# Altium project Main_Board.PrjPcb (part 38 of 44)

## Sheet uSD.SchDoc: uSD
size A4
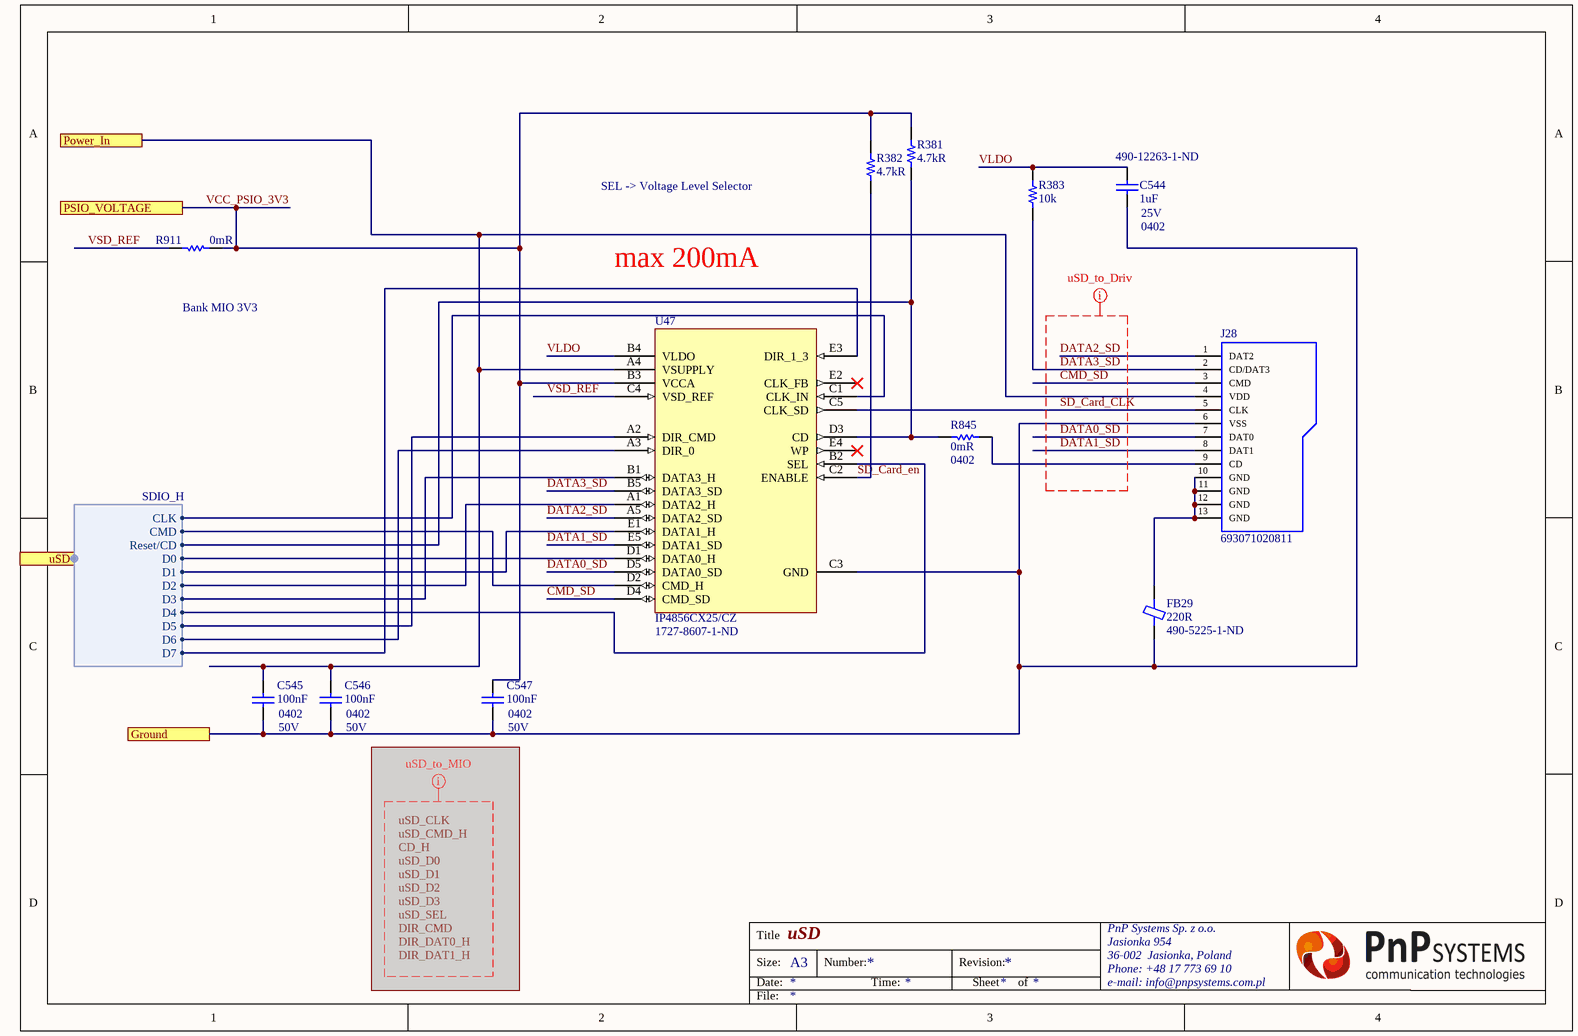
[diagram p62: uSD.SchDoc]

### Parts
(Parts that share a designator on the sheet are numbered #1, #2 ... from top to bottom, then left to right.)
C544  1uF  Supplier Part Number 1: 490-12263-1-ND  Case/Package: 0402  Voltage Rating: 25V  [CAP 0402/1005 KK]
C545  100nF  Case Code (Imperial): 0402  Voltage: 50V  [CAP 0402/1005 KK]
C546  100nF  Case Code (Imperial): 0402  Voltage: 50V  [CAP 0402/1005 KK]
C547  100nF  Case Code (Imperial): 0402  Voltage: 50V  [CAP 0402/1005 KK]
FB29  220R  Supplier Part Number 1: 490-5225-1-ND  [FER 0603/1608]
J28  693071020811  [693071020811]
R381  4.7kR  [RES 0402/1005 RF KK]
R382  4.7kR  [RES 0402/1005 RF KK]
R383  10k  [RES 0402/1005 RF KK]
R845#2  0mR  Case/Package: 0402  [RES 0402/1005 RF KK]
R911  0mR  [RES 0402/1005 RF KK]
U47  IP4856CX25/CZ  Supplier Part Number 1: 1727-8607-1-ND  [IP4856CX25/C]

### Ports
Ground, Power_In, PSIO_VOLTAGE, uSD (harness SDIO_H)

### Harnesses
SDIO_H: CLK, CMD, Reset/CD, D0, D1, D2, D3, D4, D5, D6, D7

### Nets
B503_Ground: C544.1 C545.1 C546.1 C547.1 FB29.2 J28.6(VSS) U47.C3(GND) ; port Ground
3V3_RAIL: C545.2 C546.2 J28.4(VDD) U47.A4(VSUPPLY) ; port Power_In
CMD_SD: J28.3(CMD) U47.D4(CMD_SD)
DATA0_SD: J28.7(DAT0) U47.D5(DATA0_SD)
DATA1_SD: J28.8(DAT1) U47.E5(DATA1_SD)
DATA2_SD: J28.1(DAT2) U47.A5(DATA2_SD)
DATA3_SD: J28.2(CD/DAT3) R383.2 U47.B5(DATA3_SD)
SD_Card_CLK: J28.5(CLK) U47.C5(CLK_SD)
SD_Card_en: R382.1 U47.C2(ENABLE)
uSD_CD: R381.1 R845#2.2 U47.D3(CD) ; port uSD.Reset/CD
uSD_CLK: U47.C1(CLK_IN) ; port uSD.CLK
uSD_CMD: U47.D2(CMD_H) ; port uSD.CMD
uSD_D0: U47.D1(DATA0_H) ; port uSD.D0
uSD_D1: U47.E1(DATA1_H) ; port uSD.D1
uSD_D2: U47.A1(DATA2_H) ; port uSD.D2
uSD_D3: U47.B1(DATA3_H) ; port uSD.D3
uSD_D4: U47.B2(SEL) ; port uSD.D4
uSD_D5: U47.A2(DIR_CMD) ; port uSD.D5
uSD_D6: U47.A3(DIR_0) ; port uSD.D6
uSD_D7: U47.E3(DIR_1_3) ; port uSD.D7
VCC_PSIO_3V3: C547.2 R381.2 R382.2 R911.1 U47.B3(VCCA) ; port PSIO_VOLTAGE  [project net ETH_VDDIO]
VLDO: C544.2 R383.1 U47.B4(VLDO)
VSD_REF: R911.2 U47.C4(VSD_REF)
NetFB29_1: FB29.1 J28.10(GND) J28.11(GND) J28.12(GND) J28.13(GND)
NetJ28_9: J28.9(CD) R845#2.1

Not connected (* = marked no-connect by the designer): U47 E2(CLK_FB)* E4(WP)*

### Layout directives
net class uSD_to_MIO: CD_H, DIR_CMD, DIR_DAT0_H, DIR_DAT1_H, uSD_CLK, uSD_CMD_H, uSD_D0, uSD_D1, uSD_D2, uSD_D3, uSD_SEL
net class uSD_to_Driv: CMD_SD, DATA0_SD, DATA1_SD, DATA2_SD, DATA3_SD, SD_Card_CLK

### Notes on the sheet
- SEL -> Voltage Level Selector
- Bank MIO 3V3
- max 200mA
- Title
- Size:
- Date:
- A3
- Number:
- Time:
- Revision:
- Sheet
- of
- File:

### Library data of the parts
C544 = Capacitor: as C485 on sheet RJ45; Supplier 1: Digi-Key; Manufacturer: Murata; Manufacturer Part Number: GRT155R61E105KE01D; RoHS: Yes; Category: Ceramic Capacitors; Stock 1: 415681; Pricing 1: 1=0,18000, 10=0,12300, 100=0,06210, 500=0,04248, 1000=0,03758, 2500=0,03594, 5000=0,03268 (USD); Mount: Surface Mount; Case Code (Metric): 1005; Case Code (Imperial): 0402; Min Operating Temperature: -55°C; Max Operating Temperature: 85°C; Packaging: Tape and Reel; Capacitance: 1uF; Tolerance: 10%; Dielectric: X5R; Voltage Rating (DC): 25V; Length: 0.039inch; Width: 0.02inch; Thickness: 0.022inch; Ratings: AEC-Q200; ComponentLink1URL: http://www.farnell.com/datasheets/2165918.pdf?src-supplier=Farnell; ComponentLink1Description: http://www.farnell.com/datasheets/2165918.pdf?src-supplier=Farnell; ComponentLink2URL: http://search.murata.co.jp/Ceramy/image/img/A01X/G101/ENG/GRT155R61E105KE01-01.pdf?src-supplier=Digi-Key; ComponentLink2Description: http://search.murata.co.jp/Ceramy/image/img/A01X/G101/ENG/GRT155R61E105KE01-01.pdf?src-supplier=Digi-Key; ComponentLink3URL: http://www.farnell.com/datasheets/2165918.pdf?src-supplier=Element14; ComponentLink3Description: http://www.farnell.com/datasheets/2165918.pdf?src-supplier=Element14
C545-C547 = Capacitor: as C471-C474 on sheet RJ45; Supplier 1: Digi-Key; Supplier Part Number 1: 490-10697-1-ND; RoHS: Yes; Category: Ceramic Capacitors; Stock 1: 435607; Pricing 1: 1=0,10000, 10=0,04600, 100=0,02050, 500=0,01464, 1000=0,01150, 2500=0,01045, 5000=0,00961 (USD); Mount: Surface Mount; Case/Package: 0402; Weight: 0.000212oz; Case Code (Metric): 1005; Min Operating Temperature: -55°C; Max Operating Temperature: 85°C; Capacitance: 100nF; Packaging: Tape and Reel; Voltage Rating: 50V; Dielectric: X5R; Termination: SMD/SMT; Composition: Ceramic; Voltage Rating (DC): 50V; Package Quantity: 10000; Length: 1mm; Height: 0.5mm; Width: 0.02inch; Thickness: 0.022inch; Depth: 0.5mm; REACH SVHC: No SVHC; Lead Free: Lead Free; ComponentLink1URL: http://www.farnell.com/datasheets/2079150.pdf?src-supplier=Farnell; ComponentLink1Description: http://www.farnell.com/datasheets/2079150.pdf?src-supplier=Farnell; ComponentLink2URL: http://www.mouser.com/ds/2/281/c02e-2905.pdf?src-supplier=Mouser; ComponentLink2Description: http://www.mouser.com/ds/2/281/c02e-2905.pdf?src-supplier=Mouser; ComponentLink3URL: http://www.farnell.com/datasheets/2079150.pdf?src-supplier=Element14; ComponentLink3Description: http://www.farnell.com/datasheets/2079150.pdf?src-supplier=Element14; ComponentLink4URL: http://search.murata.co.jp/Ceramy/image/img/A01X/G101/ENG/GRM155R61H104KE14-01.pdf?src-supplier=Digi-Key; ComponentLink4Description: http://search.murata.co.jp/Ceramy/image/img/A01X/G101/ENG/GRM155R61H104KE14-01.pdf?src-supplier=Digi-Key
FB29 = Ferrite: FERRITE BEAD 220 OHM 0603 1LN; Manufacturer: Murata; Manufacturer Part Number: BLM18SG221TN1D; Material: Ferrite,Steel; Tolerance: 25%; Max Current Rating: 2.5A; Number of Lines: 1; DC Resistance (DCR): 40mR; Test Frequency: 100MHz; Supplier 1: Digi-Key; RoHS: Yes; Category: Inductors; Stock 1: 123623; Pricing 1: 1=0,14000, 10=0,11600, 25=0,09040, 50=0,07500, 100=0,06460, 250=0,05172, 500=0,04654, 1000=0,03878, 5000=0,03619 (USD); Case/Package: 0603; Number of Pins: 2; Weight: 7.1E-05oz; Core Material: Ferrite; Case Code (Metric): 1608; Case Code (Imperial): 0603; Min Operating Temperature: -55°C; Max Operating Temperature: 125°C; Package Quantity: 1; Impedance: 220R; Packaging: Tape and Reel; Current Rating: 2.5A; Termination: SMD/SMT; Max DC Current: 2.5A; DC Current: 2.5A; Number of Circuits: 1; Length: 1.6mm; Height: 0.8mm; Width: 0.8mm; Depth: 0.95mm; Radiation Hardening: No; REACH SVHC: No SVHC; Lead Free: Lead Free; ComponentLink1URL: https://datasheet.ciiva.com/1561/c31e-1561456.pdf?src-supplier=Newark; ComponentLink1Description: https://datasheet.ciiva.com/1561/c31e-1561456.pdf?src-supplier=Newark; ComponentLink2URL: https://datasheet.ciiva.com/41449/001171724-da-01-en-chip-drossel0603-220r-2500ma-1-6x0-8mm-41449352.pdf?src-supplier=Conrad; ComponentLink2Description: https://datasheet.ciiva.com/41449/001171724-da-01-en-chip-drossel0603-220r-2500ma-1-6x0-8mm-41449352.pdf?src-supplier=Conrad; ComponentLink3URL: https://datasheet.ciiva.com/41449/001172313-da-01-en-drossel-0603-220r-21-6x0-8mm-10000st-41449677.pdf?src-supplier=Conrad; ComponentLink3Description: https://datasheet.ciiva.com/41449/001172313-da-01-en-drossel-0603-220r-21-6x0-8mm-10000st-41449677.pdf?src-supplier=Conrad; ComponentLink4URL: https://datasheet.ciiva.com/1012/l0110s0100blm18s-1012626.pdf?src-supplier=Digi-Key; ComponentLink4Description: https://datasheet.ciiva.com/1012/l0110s0100blm18s-1012626.pdf?src-supplier=Digi-Key; ComponentLink5URL: https://datasheet.ciiva.com/1012/l0110s0100blm18s-1012627.pdf?src-supplier=Digi-Key; ComponentLink5Description: https://datasheet.ciiva.com/1012/l0110s0100blm18s-1012627.pdf?src-supplier=Digi-Key; ComponentLink6URL: https://datasheet.ciiva.com/1012/l0110s0100blm18s-1012628.pdf?src-supplier=Digi-Key; ComponentLink6Description: https://datasheet.ciiva.com/1012/l0110s0100blm18s-1012628.pdf?src-supplier=Digi-Key; ComponentLink7URL: https://datasheet.ciiva.com/17279/l0110s0100blm18s-17279573.pdf?src-supplier=Avnet+Europe; ComponentLink7Description: https://datasheet.ciiva.com/17279/l0110s0100blm18s-17279573.pdf?src-supplier=Avnet+Europe; ComponentLink8URL: https://datasheet.ciiva.com/8508/l0110s0100blm18s-8508310.pdf?src-supplier=Avnet; ComponentLink8Description: https://datasheet.ciiva.com/8508/l0110s0100blm18s-8508310.pdf?src-supplier=Avnet; ComponentLink9URL: https://datasheet.ciiva.com/8021/5151-8021517.pdf?src-supplier=Element14; ComponentLink9Description: https://datasheet.ciiva.com/8021/5151-8021517.pdf?src-supplier=Element14; ComponentLink10URL: https://datasheet.ciiva.com/16204/l0110s0100blm18s-16204029.pdf?src-supplier=Future+Electronics; ComponentLink10Description: https://datasheet.ciiva.com/16204/l0110s0100blm18s-16204029.pdf?src-supplier=Future+Electronics; ComponentLink11URL: https://datasheet.ciiva.com/14122/blm-series-eng-tds-14122910.pdf?src-supplier=Distrelec; ComponentLink11Description: https://datasheet.ciiva.com/14122/blm-series-eng-tds-14122910.pdf?src-supplier=Distrelec; ComponentLink12URL: https://datasheet.ciiva.com/8021/5151-8021519.pdf?src-supplier=Element14; ComponentLink12Description: https://datasheet.ciiva.com/8021/5151-8021519.pdf?src-supplier=Element14
J28 = 693071020811: WR-CRD Micro SD Card Connector Push & Push; Contact Resistance: 100mOhm; Gender: Socket; Pin Number: 8; Working Voltage: 30VAC; Withstanding Voltage: 500VAC; Rated Current: 0.5A; ComponentLink1Description: Manufacturer; ComponentLink1URL: http://www.we-online.de; ComponentLink2Description: Datasheet; ComponentLink2URL: https://katalog.we-online.com/em/datasheet/693071020811.pdf; Packaging: Tape and Reel; Published Date: November 2019; Publisher: Wurth Elektronik; Mounting Technology: SMT; Operating Temperature: -40 to +85degC; Part Number: 693071020811; Type: Push & Push
R381 R382 = Resistor: Manufacturer: Panasonic; Manufacturer Part Number: ERJ-2RKF4701X; Tolerance: 1%; Temperature Coefficient: 100ppm/°C; Power Rating: 100mW; Voltage Rating: 50V; Supplier 1: Digi-Key; Supplier Part Number 1: P4.70KLCT-ND; Stock 1: 5361977; Pricing 1: 1 = 0,10000, 10 = 0,05500, 100 = 0,02250, 1000 = 0,01009, 2500 = 0,00876, 5000 = 0,00724 (USD); RoHS: Yes; Mount: Surface Mount; Case/Package: 0402; Number of Pins: 2; Case Code (Imperial): 0402; Case Code (Metric): 1005; Contact Plating: Tin; Min Operating Temperature: -55°C; Max Operating Temperature: 155°C; Resistance: 4.7kR; Packaging: Tape and Reel; Composition: Thick Film; Package Quantity: 1; Termination: SMD/SMT; Voltage Rating (DC): 50V; Number of Terminations: 2; Military Standard: Not; Max Power Dissipation: 100mW; Features: Automotive AEC-Q200; Length: 1mm; Height: 0.35mm; Width: 0.02inch; Depth: 0.5mm; Radiation Hardening: No; Lead Free: Lead Free; REACH SVHC: No SVHC; ComponentLink1URL: https://datasheet.ciiva.com/11821/0900766b80f80784-11821329.pdf?src-supplier=RSComponents; ComponentLink1Description: https://datasheet.ciiva.com/11821/0900766b80f80784-11821329.pdf?src-supplier=RSComponents; ComponentLink2URL: https://datasheet.ciiva.com/30053/aoa0000ce2-30053990.pdf?src-supplier=Onlinecomponents.com; ComponentLink2Description: https://datasheet.ciiva.com/30053/aoa0000ce2-30053990.pdf?src-supplier=Onlinecomponents.com; ComponentLink3URL: https://datasheet.ciiva.com/7830/aoa0000ce2-7830727.pdf?src-supplier=Element14; ComponentLink3Description: https://datasheet.ciiva.com/7830/aoa0000ce2-7830727.pdf?src-supplier=Element14; ComponentLink4URL: https://datasheet.ciiva.com/22781/1678782-22781576.pdf?src-supplier=Farnell; ComponentLink4Description: https://datasheet.ciiva.com/22781/1678782-22781576.pdf?src-supplier=Farnell; ComponentLink5URL: https://datasheet.ciiva.com/9195/aoa0000ce2-9195737.pdf?src-supplier=Avnet; ComponentLink5Description: https://datasheet.ciiva.com/9195/aoa0000ce2-9195737.pdf?src-supplier=Avnet; ComponentLink6URL: https://datasheet.ciiva.com/17213/aoa0000ce2-17213180.pdf?src-supplier=Avnet+Europe; ComponentLink6Description: https://datasheet.ciiva.com/17213/aoa0000ce2-17213180.pdf?src-supplier=Avnet+Europe; ComponentLink7URL: https://datasheet.ciiva.com/22667/1678782-22667886.pdf?src-supplier=Element14; ComponentLink7Description: https://datasheet.ciiva.com/22667/1678782-22667886.pdf?src-supplier=Element14; ComponentLink8URL: https://datasheet.ciiva.com/16763/70260748-16763151.pdf?src-supplier=Allied+Electronics; ComponentLink8Description: https://datasheet.ciiva.com/16763/70260748-16763151.pdf?src-supplier=Allied+Electronics; ComponentLink9URL: https://datasheet.ciiva.com/22723/1678782-22723903.pdf?src-supplier=Element14; ComponentLink9Description: https://datasheet.ciiva.com/22723/1678782-22723903.pdf?src-supplier=Element14; ComponentLink10URL: https://datasheet.ciiva.com/24025/aoa0000ce2-24025663.pdf?src-supplier=Mouser; ComponentLink10Description: https://datasheet.ciiva.com/24025/aoa0000ce2-24025663.pdf?src-supplier=Mouser
R383 = Resistor: SMT Resistor; Value: 10k; Part Number: *; Supplier 1: Digi-Key; Supplier Part Number 1: RR05P10.0KDCT-ND
R845#2 R911 = Resistor: as R711-R713 on sheet RJ45; Supplier 1: Digi-Key; Supplier Part Number 1: 311-0.0JRCT-ND; Stock 1: 69822252; Pricing 1: 1=0.10000, 10=0.01200, 25=0.00920, 50=0.00680, 100=0.00510, 250=0.00388, 500=0.00308, 1000=0.00227, 5000=0.00163 (USD); RoHS: Yes; Contact Plating: Tin,Matte; Case Code (Metric): 1005; Case Code (Imperial): 0402; Min Operating Temperature: -55°C; Max Operating Temperature: 155°C; Resistance: 0mR; Packaging: Tape and Reel; Composition: Thick Film; Package Quantity: 1; Number of Terminations: 2; Termination: SMD/SMT; Military Standard: Not; Features: Moisture Resistant; Length: 1mm; Height: 0.016inch; Width: 0.02inch; Depth: 0.5mm; Radiation Hardening: No; REACH SVHC: Unknown; Lead Free: Lead Free; ComponentLink1URL: https://datasheet.ciiva.com/2452/pyu-rc0402-51-rohs-l-6-2452608.pdf?src-supplier=Digi-Key; ComponentLink1Description: https://datasheet.ciiva.com/2452/pyu-rc0402-51-rohs-l-6-2452608.pdf?src-supplier=Digi-Key; ComponentLink2URL: https://datasheet.ciiva.com/11808/0900766b80c66297-11808195.pdf?src-supplier=RSComponents; ComponentLink2Description: https://datasheet.ciiva.com/11808/0900766b80c66297-11808195.pdf?src-supplier=RSComponents; ComponentLink3URL: https://datasheet.ciiva.com/2452/pyu-r-int-thick-7-2452609.pdf?src-supplier=Digi-Key; ComponentLink3Description: https://datasheet.ciiva.com/2452/pyu-r-int-thick-7-2452609.pdf?src-supplier=Digi-Key; ComponentLink4URL: https://datasheet.ciiva.com/22747/1018594-22747515.pdf?src-supplier=Element14; ComponentLink4Description: https://datasheet.ciiva.com/22747/1018594-22747515.pdf?src-supplier=Element14; ComponentLink5URL: https://datasheet.ciiva.com/7983/1018594-7983535.pdf?src-supplier=Element14; ComponentLink5Description: https://datasheet.ciiva.com/7983/1018594-7983535.pdf?src-supplier=Element14; ComponentLink6URL: https://datasheet.ciiva.com/2452/pyu-r-int-thick-7-2452610.pdf?src-supplier=Digi-Key; ComponentLink6Description: https://datasheet.ciiva.com/2452/pyu-r-int-thick-7-2452610.pdf?src-supplier=Digi-Key; ComponentLink7URL: https://datasheet.ciiva.com/8896/pyu-rc0402-51-rohs-l-6-8896201.pdf?src-supplier=Avnet; ComponentLink7Description: https://datasheet.ciiva.com/8896/pyu-rc0402-51-rohs-l-6-8896201.pdf?src-supplier=Avnet; ComponentLink8URL: https://datasheet.ciiva.com/28386/pyu-rc0402-51-rohs-l-6-28386633.pdf?src-supplier=Avnet+Europe; ComponentLink8Description: https://datasheet.ciiva.com/28386/pyu-rc0402-51-rohs-l-6-28386633.pdf?src-supplier=Avnet+Europe; ComponentLink9URL: https://datasheet.ciiva.com/15189/getdatasheetpartid-326379-15189533.pdf?src-supplier=Verical; ComponentLink9Description: https://datasheet.ciiva.com/15189/getdatasheetpartid-326379-15189533.pdf?src-supplier=Verical
  R911: Case/Package: 0402
U47 = IP4856CX25/CZ: Memory Card Interface 25-WLCSP (2.04x2.04); Manufacturer 1: Nexperia USA; Supplier 1: Digi-Key; Manufacturer Part Number 1: IP4856CX25/CZ; Stock 1: 3532; Pricing 1: 1=1,52000, 10=1,36500, 100=1,03000, 500=0,87550, 1000=0,69525 (USD); RoHS: No; ComponentLink1Description: Datasheet; ComponentLink1URL: https://assets.nexperia.com/documents/data-sheet/IP4856CX25_C.pdf

## Sheet FTDI.SchDoc
size A3; Organization: Altium Limited; Address1: L3, 12a Rodborough Rd; Address2: Frenchs Forest; Address3: NSW; Address4: Australia 2086
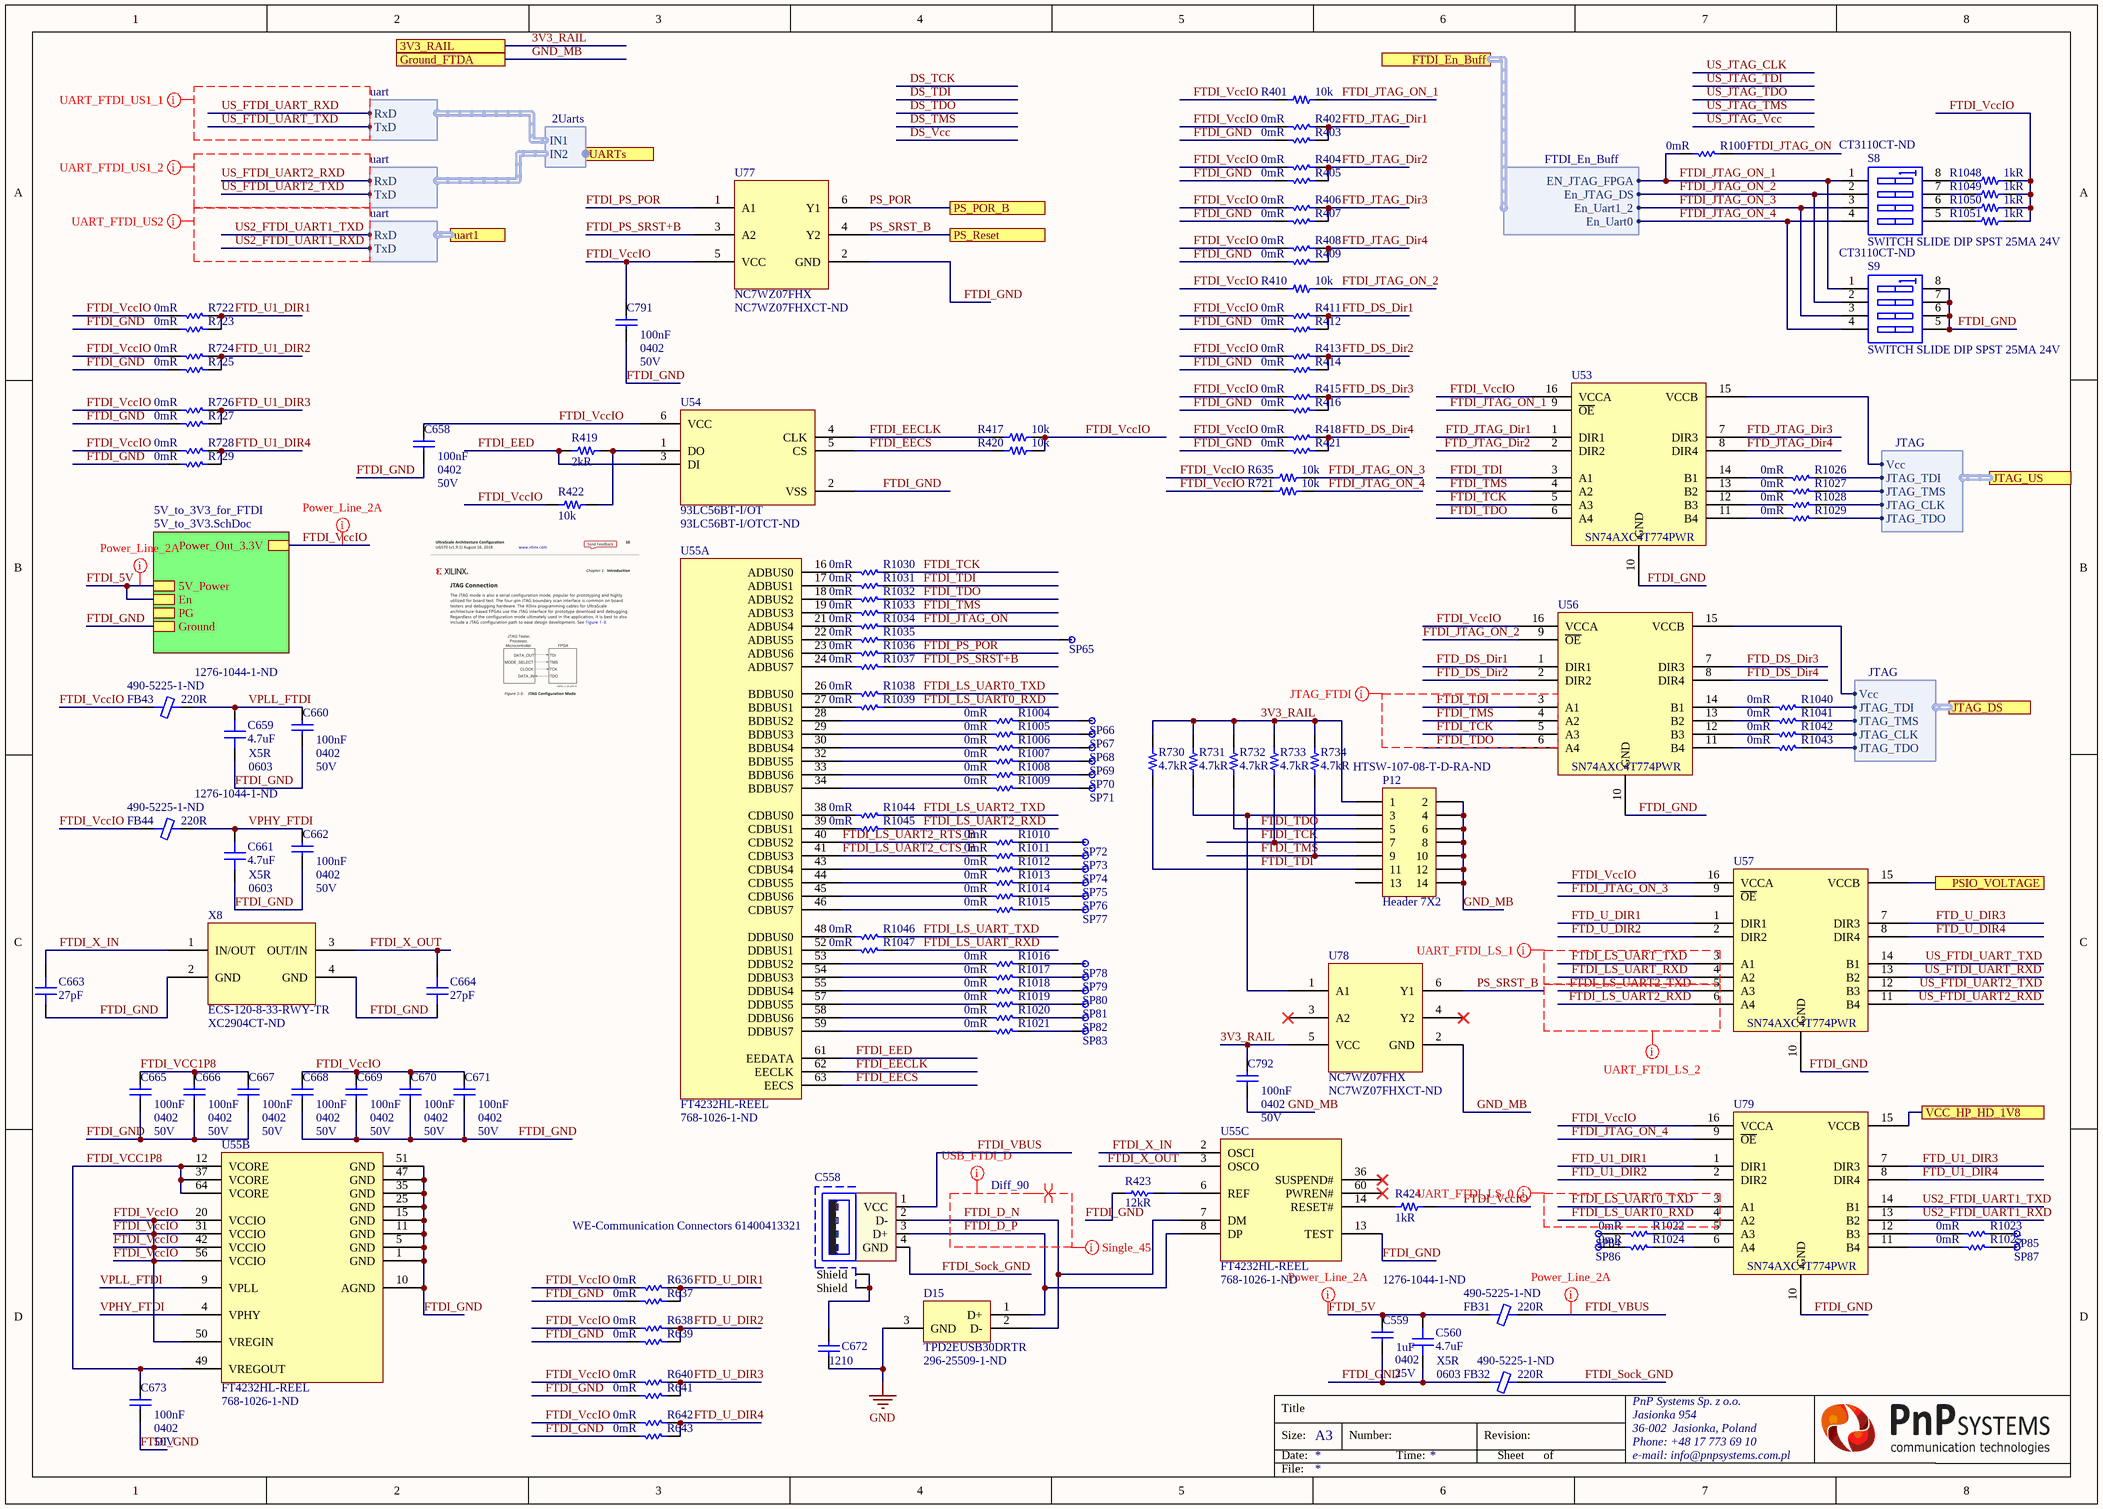
[diagram p63: FTDI.SchDoc]

### Parts
C558  WE-Communication Connectors 61400413321  [61400413321]
C559  1uF  Case/Package: 0402  Voltage Rating: 25V  [CAP 0402/1005 KK]
C560  4.7uF  Supplier Part Number 1: 1276-1044-1-ND  Case/Package: 0603  Dielectric: X5R  [CAP 0603/1608 RF]
C658  100nF  Case Code (Imperial): 0402  Voltage: 50V  [CAP 0402/1005 KK]
C659  4.7uF  Supplier Part Number 1: 1276-1044-1-ND  Case/Package: 0603  Dielectric: X5R  [CAP 0603/1608 RF]
C660  100nF  Case Code (Imperial): 0402  Voltage: 50V  [CAP 0402/1005 KK]
C661  4.7uF  Supplier Part Number 1: 1276-1044-1-ND  Case/Package: 0603  Dielectric: X5R  [CAP 0603/1608 RF]
C662  100nF  Case Code (Imperial): 0402  Voltage: 50V  [CAP 0402/1005 KK]
C663  27pF  [CAP 0402/1005 KK]
C664  27pF  [CAP 0402/1005 KK]
C665  100nF  Case Code (Imperial): 0402  Voltage: 50V  [CAP 0402/1005 KK]
C666  100nF  Case Code (Imperial): 0402  Voltage: 50V  [CAP 0402/1005 KK]
C667  100nF  Case Code (Imperial): 0402  Voltage: 50V  [CAP 0402/1005 KK]
C668  100nF  Case Code (Imperial): 0402  Voltage: 50V  [CAP 0402/1005 KK]
C669  100nF  Case Code (Imperial): 0402  Voltage: 50V  [CAP 0402/1005 KK]
C670  100nF  Case Code (Imperial): 0402  Voltage: 50V  [CAP 0402/1005 KK]
C671  100nF  Case Code (Imperial): 0402  Voltage: 50V  [CAP 0402/1005 KK]
C672  Case/Package: 1210  [CAPC3326X17L]  (hidden comment: Capacitor_1210)
C673  100nF  Case Code (Imperial): 0402  Voltage: 50V  [CAP 0402/1005 KK]
C791  100nF  Case Code (Imperial): 0402  Voltage: 50V  [CAP 0402/1005 KK]
C792  100nF  Case Code (Imperial): 0402  Voltage: 50V  [CAP 0402/1005 KK]
D15  TPD2EUSB30DRTR  Supplier Part Number 1: 296-25509-1-ND  [TPD2EUSB30]
FB31  220R  Supplier Part Number 1: 490-5225-1-ND  [FER 0603/1608]
FB32  220R  Supplier Part Number 1: 490-5225-1-ND  [FER 0603/1608]
FB43  220R  Supplier Part Number 1: 490-5225-1-ND  [FER 0603/1608]
FB44  220R  Supplier Part Number 1: 490-5225-1-ND  [FER 0603/1608]
P12  Header 7X2  Supplier Part Number 1: HTSW-107-08-T-D-RA-ND  [HDR2X7]
R401  10k  [RES 0402/1005 RF KK]
R402  0mR  [RES 0402/1005 RF KK]
R403  0mR  [RES 0402/1005 RF KK]
R404  0mR  [RES 0402/1005 RF KK]
R405  0mR  [RES 0402/1005 RF KK]
R406  0mR  [RES 0402/1005 RF KK]
R407  0mR  [RES 0402/1005 RF KK]
R408  0mR  [RES 0402/1005 RF KK]
R409  0mR  [RES 0402/1005 RF KK]
R410  10k  [RES 0402/1005 RF KK]
R411  0mR  [RES 0402/1005 RF KK]
R412  0mR  [RES 0402/1005 RF KK]
R413  0mR  [RES 0402/1005 RF KK]
R414  0mR  [RES 0402/1005 RF KK]
R415  0mR  [RES 0402/1005 RF KK]
R416  0mR  [RES 0402/1005 RF KK]
R417  10k  [RES 0402/1005 RF KK]
R418  0mR  [RES 0402/1005 RF KK]
R419  2kR  [RES 0402/1005 RF KK]
R420  10k  [RES 0402/1005 RF KK]
R421  0mR  [RES 0402/1005 RF KK]
R422  10k  [RES 0402/1005 RF KK]
R423  12kR  [RES 0402/1005 RF KK]
R424  1kR  [RES 0402/1005 RF KK]
R635  10k  [RES 0402/1005 RF KK]
R636  0mR  [RES 0402/1005 RF KK]
R637  0mR  [RES 0402/1005 RF KK]
R638  0mR  [RES 0402/1005 RF KK]
R639  0mR  [RES 0402/1005 RF KK]
R640  0mR  [RES 0402/1005 RF KK]
R641  0mR  [RES 0402/1005 RF KK]
R642  0mR  [RES 0402/1005 RF KK]
R643  0mR  [RES 0402/1005 RF KK]
R721  10k  [RES 0402/1005 RF KK]
R722  0mR  [RES 0402/1005 RF KK]
R723  0mR  [RES 0402/1005 RF KK]
R724  0mR  [RES 0402/1005 RF KK]
R725  0mR  [RES 0402/1005 RF KK]
R726  0mR  [RES 0402/1005 RF KK]
R727  0mR  [RES 0402/1005 RF KK]
R728  0mR  [RES 0402/1005 RF KK]
R729  0mR  [RES 0402/1005 RF KK]
R730  4.7kR  [RES 0402/1005 RF KK]
R731  4.7kR  [RES 0402/1005 RF KK]
R732  4.7kR  [RES 0402/1005 RF KK]
R733  4.7kR  [RES 0402/1005 RF KK]
R734  4.7kR  [RES 0402/1005 RF KK]
R1001  0mR  [RES 0402/1005 RF KK]
R1004  0mR  [RES 0402/1005 RF KK]
R1005  0mR  [RES 0402/1005 RF KK]
R1006  0mR  [RES 0402/1005 RF KK]
R1007  0mR  [RES 0402/1005 RF KK]
R1008  0mR  [RES 0402/1005 RF KK]
R1009  0mR  [RES 0402/1005 RF KK]
R1010  0mR  [RES 0402/1005 RF KK]
R1011  0mR  [RES 0402/1005 RF KK]
R1012  0mR  [RES 0402/1005 RF KK]
R1013  0mR  [RES 0402/1005 RF KK]
R1014  0mR  [RES 0402/1005 RF KK]
R1015  0mR  [RES 0402/1005 RF KK]
R1016  0mR  [RES 0402/1005 RF KK]
R1017  0mR  [RES 0402/1005 RF KK]
R1018  0mR  [RES 0402/1005 RF KK]
R1019  0mR  [RES 0402/1005 RF KK]
R1020  0mR  [RES 0402/1005 RF KK]
R1021  0mR  [RES 0402/1005 RF KK]
R1022  0mR  [RES 0402/1005 RF KK]
R1023  0mR  [RES 0402/1005 RF KK]
R1024  0mR  [RES 0402/1005 RF KK]
R1025  0mR  [RES 0402/1005 RF KK]
R1026  0mR  [RES 0402/1005 RF KK]
R1027  0mR  [RES 0402/1005 RF KK]
R1028  0mR  [RES 0402/1005 RF KK]
R1029  0mR  [RES 0402/1005 RF KK]
R1030  0mR  [RES 0402/1005 RF KK]
R1031  0mR  [RES 0402/1005 RF KK]
R1032  0mR  [RES 0402/1005 RF KK]
R1033  0mR  [RES 0402/1005 RF KK]
R1034  0mR  [RES 0402/1005 RF KK]
R1035  0mR  [RES 0402/1005 RF KK]
R1036  0mR  [RES 0402/1005 RF KK]
R1037  0mR  [RES 0402/1005 RF KK]
R1038  0mR  [RES 0402/1005 RF KK]
R1039  0mR  [RES 0402/1005 RF KK]
R1040  0mR  [RES 0402/1005 RF KK]
R1041  0mR  [RES 0402/1005 RF KK]
R1042  0mR  [RES 0402/1005 RF KK]
R1043  0mR  [RES 0402/1005 RF KK]
R1044  0mR  [RES 0402/1005 RF KK]
R1045  0mR  [RES 0402/1005 RF KK]
R1046  0mR  [RES 0402/1005 RF KK]
R1047  0mR  [RES 0402/1005 RF KK]
R1048  1kR  [RES 0402/1005 RF KK]
R1049  1kR  [RES 0402/1005 RF KK]
R1050  1kR  [RES 0402/1005 RF KK]
R1051  1kR  [RES 0402/1005 RF KK]
S8  SWITCH SLIDE DIP SPST 25MA 24V  Supplier Part Number 1: CT3110CT-ND  [SO8_N]
S9  SWITCH SLIDE DIP SPST 25MA 24V  Supplier Part Number 1: CT3110CT-ND  [SO8_N]
SP65  SP  [MeasureTP]  (value not drawn)
SP66  SP  [MeasureTP]  (value not drawn)
SP67  SP  [MeasureTP]  (value not drawn)
SP68  SP  [MeasureTP]  (value not drawn)
SP69  SP  [MeasureTP]  (value not drawn)
SP70  SP  [MeasureTP]  (value not drawn)
SP71  SP  [MeasureTP]  (value not drawn)
SP72  SP  [MeasureTP]  (value not drawn)
SP73  SP  [MeasureTP]  (value not drawn)
SP74  SP  [MeasureTP]  (value not drawn)
SP75  SP  [MeasureTP]  (value not drawn)
SP76  SP  [MeasureTP]  (value not drawn)
SP77  SP  [MeasureTP]  (value not drawn)
SP78  SP  [MeasureTP]  (value not drawn)
SP79  SP  [MeasureTP]  (value not drawn)
SP80  SP  [MeasureTP]  (value not drawn)
SP81  SP  [MeasureTP]  (value not drawn)
SP82  SP  [MeasureTP]  (value not drawn)
SP83  SP  [MeasureTP]  (value not drawn)
SP84  SP  [MeasureTP]  (value not drawn)
SP85  SP  [MeasureTP]  (value not drawn)
SP86  SP  [MeasureTP]  (value not drawn)
SP87  SP  [MeasureTP]  (value not drawn)
U53  SN74AXC4T774PWR  [SN74AXC4T774PWR]
U54  93LC56BT-I/OT  Supplier Part Number 1: 93LC56BT-I/OTCT-ND  [93LC56BT]
U55  FT4232HL-REEL  Supplier Part Number 1: 768-1026-1-ND  [FT4232HL]  (parts A,B,C of 3)
U56  SN74AXC4T774PWR  [SN74AXC4T774PWR]
U57  SN74AXC4T774PWR  [SN74AXC4T774PWR]
U77  NC7WZ07FHX  Supplier Part Number 1: NC7WZ07FHXCT-ND  [NC7WZ07FHX]
U78  NC7WZ07FHX  Supplier Part Number 1: NC7WZ07FHXCT-ND  [NC7WZ07FHX]
U79  SN74AXC4T774PWR  [SN74AXC4T774PWR]
X8  ECS-120-8-33-RWY-TR  Supplier Part Number 1: XC2904CT-ND  [ECS-120-8-33-RWY-TR]

### Sub-sheets
5V_to_3V3_for_FTDI = 5V_to_3V3.SchDoc: En, 5V_Power, PG, Ground, Power_Out_3.3V

### Ports
3V3_RAIL, FTDI_En_Buff (harness FTDI_En_Buff), Ground_FTDA, JTAG_DS (harness JTAG), JTAG_US (harness JTAG), PS_POR_B, PS_Reset, PSIO_VOLTAGE, uart1 (harness uart), UARTs (harness 2Uarts), VCC_HP_HD_1V8

### Harnesses
uart: RxD, TxD
JTAG: JTAG_CLK, JTAG_TDI, JTAG_TDO, JTAG_TMS, Vcc
FTDI_En_Buff: EN_JTAG_FPGA, En_JTAG_DS, En_Uart1_2, En_Uart0
2Uarts: IN1, IN2

### Nets
GND: C672.1 C792.1 D15.3(GND) P12.2 P12.4 P12.6 P12.8 P12.10 P12.12 P12.14 U78.2(GND) ; port Ground_FTDA  [also labelled GND_MB]  [project net B503_Ground]
3V3_RAIL: C792.2 P12.1 R730.2 R731.2 R732.2 R733.2 R734.2 U78.5(VCC) ; port 3V3_RAIL
ETH_VDDIO: U53.15(VCCB) U56.15(VCCB) U57.15(VCCB) ; port PSIO_VOLTAGE, port JTAG_DS.Vcc, port JTAG_US.Vcc
FTD_DS_Dir1: R411.2 R412.2 U56.1(DIR1)
FTD_DS_Dir2: R413.2 R414.2 U56.2(DIR2)
FTD_DS_Dir3: R415.2 R416.2 U56.7(DIR3)
FTD_DS_Dir4: R418.2 R421.2 U56.8(DIR4)
FTD_JTAG_Dir1: R402.2 R403.2 U53.1(DIR1)
FTD_JTAG_Dir2: R404.2 R405.2 U53.2(DIR2)
FTD_JTAG_Dir3: R406.2 R407.2 U53.7(DIR3)
FTD_JTAG_Dir4: R408.2 R409.2 U53.8(DIR4)
FTD_U1_DIR1: R722.2 R723.2 U79.1(DIR1)
FTD_U1_DIR2: R724.2 R725.2 U79.2(DIR2)
FTD_U1_DIR3: R726.2 R727.2 U79.7(DIR3)
FTD_U1_DIR4: R728.2 R729.2 U79.8(DIR4)
FTD_U_DIR1: R636.2 R637.2 U57.1(DIR1)
FTD_U_DIR2: R638.2 R639.2 U57.2(DIR2)
FTD_U_DIR3: R640.2 R641.2 U57.7(DIR3)
FTD_U_DIR4: R642.2 R643.2 U57.8(DIR4)
FTDI_5V: C559.1 C560.2 FB31.1 ; sheet 5V_to_3V3_for_FTDI/En, sheet 5V_to_3V3_for_FTDI/5V_Power
FTDI_D_N: C558.2(D-) D15.2(D-) U55.7(DM)
FTDI_D_P: C558.3(D+) D15.1(D+) U55.8(DP)
FTDI_EECLK: R417.2 U54.4(CLK) U55.62(EECLK)
FTDI_EECS: R420.2 U54.5(CS) U55.63(EECS)
FTDI_EED: R419.1 U54.3(DI) U55.61(EEDATA)
FTDI_GND: C559.2 C560.1 C658.1 C659.1 C660.1 C661.1 C662.1 C663.1 C664.1 C665.1 C666.1 C667.1 C668.1 C669.1 C670.1 C671.1 C673.1 C791.1 FB32.1 R403.1 R405.1 R407.1 R409.1 R412.1 R414.1 R416.1 R421.1 R423.2 R637.1 R639.1 R641.1 R643.1 R723.1 R725.1 R727.1 R729.1 S9.5(B4) S9.6(B3) S9.7(B2) S9.8(B1) U53.10(GND) U54.2(VSS) U55.1(GND) U55.5(GND) U55.10(AGND) U55.11(GND) U55.13(TEST) U55.15(GND) U55.25(GND) U55.35(GND) U55.47(GND) U55.51(GND) U56.10(GND) U57.10(GND) U77.2(GND) U79.10(GND) X8.2(GND) X8.4(GND) ; sheet 5V_to_3V3_for_FTDI/Ground
FTDI_JTAG_ON: R1001.2 R1034.2
FTDI_JTAG_ON_1: R401.1 R1001.1 S8.1(A1) S9.1(A1) U53.9(~{OE}) ; port FTDI_En_Buff.EN_JTAG_FPGA
FTDI_JTAG_ON_2: R410.1 S8.2(A2) S9.2(A2) U56.9(~{OE}) ; port FTDI_En_Buff.En_JTAG_DS
FTDI_JTAG_ON_3: R635.1 S8.3(A3) S9.3(A3) U57.9(~{OE}) ; port FTDI_En_Buff.En_Uart1_2
FTDI_JTAG_ON_4: R721.1 S8.4(A4) S9.4(A4) U79.9(~{OE}) ; port FTDI_En_Buff.En_Uart0
FTDI_LS_UART0_RXD: R1039.2 U79.4(A2)
FTDI_LS_UART0_TXD: R1038.2 U79.3(A1)
FTDI_LS_UART2_CTS_B: R1011.1 U55.41(CDBUS3)
FTDI_LS_UART2_RTS_B: R1010.1 U55.40(CDBUS2)
FTDI_LS_UART2_RXD: R1045.2 U57.6(A4)
FTDI_LS_UART2_TXD: R1044.2 U57.5(A3)
FTDI_LS_UART_RXD: R1047.2 U57.4(A2)
FTDI_LS_UART_TXD: R1046.2 U57.3(A1)
FTDI_PS_POR: R1036.2 U77.1(A1)
FTDI_PS_SRST+B: R1037.2 U77.3(A2)
FTDI_Sock_GND: C558.4(GND) FB32.2
FTDI_TCK: P12.7 R733.1 R1030.2 U53.5(A3) U56.5(A3)
FTDI_TDI: P12.11 R730.1 R1031.2 U53.3(A1) U56.3(A1)
FTDI_TDO: P12.5 R732.1 R1032.2 U53.6(A4) U56.6(A4)
FTDI_TMS: P12.9 R734.1 R1033.2 U53.4(A2) U56.4(A2)
FTDI_VBUS: C558.1(VCC) FB31.2
FTDI_VCC1P8: C665.2 C666.2 C667.2 C673.2 U55.12(VCORE) U55.37(VCORE) U55.49(VREGOUT) U55.64(VCORE)
FTDI_VccIO: C658.2 C668.2 C669.2 C670.2 C671.2 C791.2 FB43.1 FB44.1 R401.2 R402.1 R404.1 R406.1 R408.1 R410.2 R411.1 R413.1 R415.1 R417.1 R418.1 R420.1 R422.2 R424.1 R635.2 R636.1 R638.1 R640.1 R642.1 R721.2 R722.1 R724.1 R726.1 R728.1 R1048.1 R1049.1 R1050.1 R1051.1 U53.16(VCCA) U54.6(VCC) U55.20(VCCIO) U55.31(VCCIO) U55.42(VCCIO) U55.50(VREGIN) U55.56(VCCIO) U56.16(VCCA) U57.16(VCCA) U77.5(VCC) U79.16(VCCA) ; sheet 5V_to_3V3_for_FTDI/Power_Out_3.3V
FTDI_X_IN: C663.2 U55.2(OSCI) X8.1(IN/OUT)
FTDI_X_OUT: C664.2 U55.3(OSCO) X8.3(OUT/IN)
JTAG_CLK: R1042.1 ; port JTAG_DS.JTAG_CLK
JTAG_TDI: R1040.1 ; port JTAG_DS.JTAG_TDI
JTAG_TDO: R1043.1 ; port JTAG_DS.JTAG_TDO
JTAG_TMS: R1041.1 ; port JTAG_DS.JTAG_TMS
PS_POR: U77.6(Y1) ; port PS_POR_B
PS_SRST_B: U77.4(Y2) U78.6(Y1) ; port PS_Reset  [project net PS_Reset]
US2_FTDI_UART1_RXD: U79.13(B2) ; port uart1.TxD
US2_FTDI_UART1_TXD: U79.14(B1) ; port uart1.RxD
US+_MGTVccAux: U79.15(VCCB) ; port VCC_HP_HD_1V8
US_FTDI_UART2_RXD: U57.11(B4) ; harness uart.RxD  [project net uart0_TxD]
US_FTDI_UART2_TXD: U57.12(B3) ; harness uart.TxD  [project net uart0_RxD]
US_FTDI_UART_RXD: U57.13(B2) ; harness uart.RxD  [project net uart1_RxD]
US_FTDI_UART_TXD: U57.14(B1) ; harness uart.TxD  [project net uart1_TxD]
US_PS_JTAG_TCK: R1028.2 ; port JTAG_US.JTAG_CLK
US_PS_JTAG_TDI: R1026.2 ; port JTAG_US.JTAG_TDI
US_PS_JTAG_TDO: R1029.2 ; port JTAG_US.JTAG_TDO
US_PS_JTAG_TMS: R1027.2 ; port JTAG_US.JTAG_TMS
VPHY_FTDI: C661.2 C662.2 FB44.2 U55.4(VPHY)
VPLL_FTDI: C659.2 C660.2 FB43.2 U55.9(VPLL)
NetC558_Z1: C558.Z1(Shield) C558.Z2(Shield) C672.2
NetP12_3: P12.3 R731.1 U78.1(A1)
NetR419_2: R419.2 R422.1 U54.1(DO)
NetR423_1: R423.1 U55.6(REF)
NetR424_2: R424.2 U55.14(RESET#)
NetR1004_1: R1004.1 U55.28(BDBUS2)
NetR1004_2: R1004.2 SP66.1
NetR1005_1: R1005.1 U55.29(BDBUS3)
NetR1005_2: R1005.2 SP67.1
NetR1006_1: R1006.1 U55.30(BDBUS4)
NetR1006_2: R1006.2 SP68.1
NetR1007_1: R1007.1 U55.32(BDBUS5)
NetR1007_2: R1007.2 SP69.1
NetR1008_1: R1008.1 U55.33(BDBUS6)
NetR1008_2: R1008.2 SP70.1
NetR1009_1: R1009.1 U55.34(BDBUS7)
NetR1009_2: R1009.2 SP71.1
NetR1010_2: R1010.2 SP72.1
NetR1011_2: R1011.2 SP73.1
NetR1012_1: R1012.1 U55.43(CDBUS4)
NetR1012_2: R1012.2 SP74.1
NetR1013_1: R1013.1 U55.44(CDBUS5)
NetR1013_2: R1013.2 SP75.1
NetR1014_1: R1014.1 U55.45(CDBUS6)
NetR1014_2: R1014.2 SP76.1
NetR1015_1: R1015.1 U55.46(CDBUS7)
NetR1015_2: R1015.2 SP77.1
NetR1016_1: R1016.1 U55.53(DDBUS2)
NetR1016_2: R1016.2 SP78.1
NetR1017_1: R1017.1 U55.54(DDBUS3)
NetR1017_2: R1017.2 SP79.1
NetR1018_1: R1018.1 U55.55(DDBUS4)
NetR1018_2: R1018.2 SP80.1
NetR1019_1: R1019.1 U55.57(DDBUS5)
NetR1019_2: R1019.2 SP81.1
NetR1020_1: R1020.1 U55.58(DDBUS6)
NetR1020_2: R1020.2 SP82.1
NetR1021_1: R1021.1 U55.59(DDBUS7)
NetR1021_2: R1021.2 SP83.1
NetR1022_1: R1022.1 SP84.1
NetR1022_2: R1022.2 U79.5(A3)
NetR1023_1: R1023.1 U79.12(B3)
NetR1023_2: R1023.2 SP85.1
NetR1024_1: R1024.1 SP86.1
NetR1024_2: R1024.2 U79.6(A4)
NetR1025_1: R1025.1 U79.11(B4)
NetR1025_2: R1025.2 SP87.1
NetR1026_1: R1026.1 U53.14(B1)
NetR1027_1: R1027.1 U53.13(B2)
NetR1028_1: R1028.1 U53.12(B3)
NetR1029_1: R1029.1 U53.11(B4)
NetR1030_1: R1030.1 U55.16(ADBUS0)
NetR1031_1: R1031.1 U55.17(ADBUS1)
NetR1032_1: R1032.1 U55.18(ADBUS2)
NetR1033_1: R1033.1 U55.19(ADBUS3)
NetR1034_1: R1034.1 U55.21(ADBUS4)
NetR1035_1: R1035.1 U55.22(ADBUS5)
NetR1035_2: R1035.2 SP65.1
NetR1036_1: R1036.1 U55.23(ADBUS6)
NetR1037_1: R1037.1 U55.24(ADBUS7)
NetR1038_1: R1038.1 U55.26(BDBUS0)
NetR1039_1: R1039.1 U55.27(BDBUS1)
NetR1040_2: R1040.2 U56.14(B1)
NetR1041_2: R1041.2 U56.13(B2)
NetR1042_2: R1042.2 U56.12(B3)
NetR1043_2: R1043.2 U56.11(B4)
NetR1044_1: R1044.1 U55.38(CDBUS0)
NetR1045_1: R1045.1 U55.39(CDBUS1)
NetR1046_1: R1046.1 U55.48(DDBUS0)
NetR1047_1: R1047.1 U55.52(DDBUS1)
NetR1048_2: R1048.2 S8.8(B1)
NetR1049_2: R1049.2 S8.7(B2)
NetR1050_2: R1050.2 S8.6(B3)
NetR1051_2: R1051.2 S8.5(B4)

Not connected (* = marked no-connect by the designer): P12 13; U55 36(SUSPEND#)* 60(PWREN#)*; U78 3(A2)* 4(Y2)*

### Layout directives
net class Power_Line_2A: FTDI_5V, FTDI_VBUS, FTDI_VccIO
net class USB_FTDI_D: FTDI_D_N, FTDI_D_P
differential pair; differential pair class Diff_90: FTDI_D_N, FTDI_D_P
net class Single_45: FTDI_D_N, FTDI_D_P
net class UART_FTDI_US2: US2_FTDI_UART1_RXD, US2_FTDI_UART1_TXD
net class UART_FTDI_US1_2: US_FTDI_UART2_RXD, US_FTDI_UART2_TXD
net class UART_FTDI_US1_1: US_FTDI_UART_RXD, US_FTDI_UART_TXD
net class UART_FTDI_LS_0: FTDI_LS_UART0_RXD, FTDI_LS_UART0_TXD
net class UART_FTDI_LS_2: FTDI_LS_UART2_RXD, FTDI_LS_UART2_TXD
net class UART_FTDI_LS_1: FTDI_LS_UART_RXD, FTDI_LS_UART_TXD
net class JTAG_FTDI: FTDI_TCK, FTDI_TDI, FTDI_TDO, FTDI_TMS

### Notes on the sheet
- Title
- Size:
- Date:
- A3
- Number:
- Time:
- Revision:
- Sheet
- of
- File: